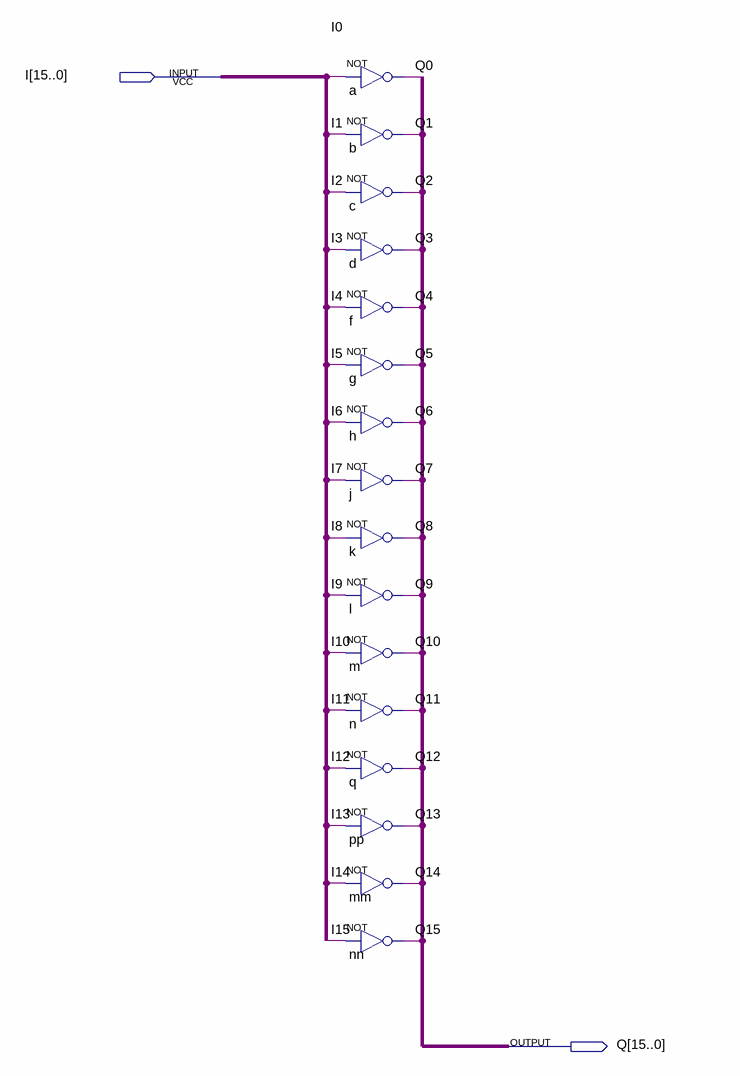
[diagram p0: schematic sheet]
// Quartus schematic NOT16.bdf as structural Verilog: 16 symbols, 2 pins
module NOT16 (
  input  [15:0] I,
  output [15:0] Q
);

  not a (Q[0], I[0]);
  not b (Q[1], I[1]);
  not c (Q[2], I[2]);
  not d (Q[3], I[3]);
  not f (Q[4], I[4]);
  not g (Q[5], I[5]);
  not h (Q[6], I[6]);
  not j (Q[7], I[7]);
  not k (Q[8], I[8]);
  not l (Q[9], I[9]);
  not m (Q[10], I[10]);
  not n (Q[11], I[11]);
  not u_q (Q[12], I[12]);
  not pp (Q[13], I[13]);
  not mm (Q[14], I[14]);
  not nn (Q[15], I[15]);
endmodule
